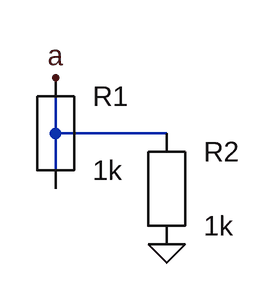
[diagram p0: schematic same_instance_t_junction.asc]
same_instance_t_junction.asc, the LTspice schematic file:
Version 4
SHEET 1 880 680
WIRE 96 96 96 192
WIRE 96 144 192 144
FLAG 96 96 a
FLAG 192 240 0
SYMBOL res 96 144 R0
SYMATTR InstName R1
SYMATTR Value 1k
SYMBOL res 192 192 R0
SYMATTR InstName R2
SYMATTR Value 1k

The netlist it stands for:
* same_instance_t_junction.asc
R1 a a 1k
R2 a 0 1k
.backanno
.end